# Altium schematic sheet Control & Inputs.SchDoc
size A; SheetNumber: 2; SheetTotal: 3
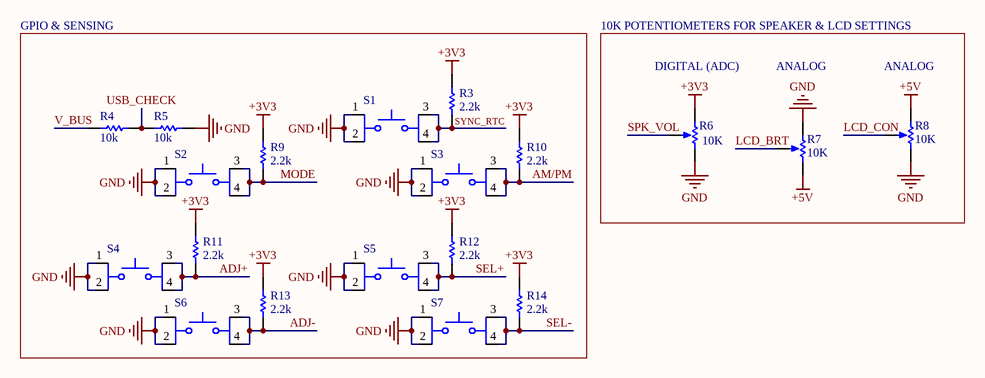
[diagram p0: Control & Inputs.SchDoc]

## Parts
R3  Resistance: 2.2k  [RESA60-630X240]  (hidden comment: MFR-25FBF52-1M)
R4  Resistance: 10k  [RESA60-630X240]  (hidden comment: MFR-25FBF52-1M)
R5  Resistance: 10k  [RESA60-630X240]  (hidden comment: MFR-25FBF52-1M)
R6  value 10K  [POT OFFSET 200]  (hidden comment: RPot_3)
R7  value 10K  [POT OFFSET 200]  (hidden comment: RPot_3)
R8  value 10K  [POT OFFSET 200]  (hidden comment: RPot_3)
R9  Resistance: 2.2k  [RESA60-630X240]  (hidden comment: MFR-25FBF52-1M)
R10  Resistance: 2.2k  [RESA60-630X240]  (hidden comment: MFR-25FBF52-1M)
R11  Resistance: 2.2k  [RESA60-630X240]  (hidden comment: MFR-25FBF52-1M)
R12  Resistance: 2.2k  [RESA60-630X240]  (hidden comment: MFR-25FBF52-1M)
R13  Resistance: 2.2k  [RESA60-630X240]  (hidden comment: MFR-25FBF52-1M)
R14  Resistance: 2.2k  [RESA60-630X240]  (hidden comment: MFR-25FBF52-1M)
S1  TL1105AF160Q  [SW_TL1105AF160Q]  (value not drawn)
S2  TL1105AF160Q  [SW_TL1105AF160Q]  (value not drawn)
S3  TL1105AF160Q  [SW_TL1105AF160Q]  (value not drawn)
S4  TL1105AF160Q  [SW_TL1105AF160Q]  (value not drawn)
S5  TL1105AF160Q  [SW_TL1105AF160Q]  (value not drawn)
S6  TL1105AF160Q  [SW_TL1105AF160Q]  (value not drawn)
S7  TL1105AF160Q  [SW_TL1105AF160Q]  (value not drawn)

## Blocks framed on the sheet
GPIO & SENSING: R3-R5 R9-R14 S1-S7

## Nets
+3V3: R3.2 R6.1(TOP) R9.2 R10.2 R11.2 R12.2 R13.2 R14.2
+5V: R7.3(BOT) R8.1(TOP)
GND: R5.2 R6.3(BOT) R7.1(TOP) R8.3(BOT) S1.1 S1.2 S2.1 S2.2 S3.1 S3.2 S4.1 S4.2 S5.1 S5.2 S6.1 S6.2 S7.1 S7.2
ADJ+: R11.1 S4.3 S4.4
ADJ-: R13.1 S6.3 S6.4
AM/PM: R10.1 S3.3 S3.4
LCD_BRT: R7.2(TAP)
LCD_CON: R8.2(TAP)
MODE: R9.1 S2.3 S2.4
SEL+: R12.1 S5.3 S5.4
SEL-: R14.1 S7.3 S7.4
SPK_VOL: R6.2(TAP)
SYNC_RTC: R3.1 S1.3 S1.4
USB_CHECK: R4.2 R5.1
V_BUS: R4.1

## Notes on the sheet
- 10K POTENTIOMETERS FOR SPEAKER & LCD SETTINGS
- (near R6) DIGITAL (ADC)
- ANALOG
- (near R8) ANALOG

## Library data of the parts
R3-R5 R9-R14 = CMP-1659-00070-1: Axial Resistor, 1 MOhm, +/- 1%, 250 mW, -55 to 155 degC, 2-Pin THD, RoHS, Bulk; Power Rating: 250 mW; Voltage Rating: 250 V; ComponentLink1Description: Manufacturer URL; PackageReference: MFR-25; ComponentLink2Description: Datasheet; ComponentLink2URL: http://www.yageo.com/documents/recent/Yageo%20LR_MFR_2013.pdf; Tolerance: 1%; DatasheetVersion: Apr-13; Package Quantity: 200; Packaging: Bulk; Case\Package: Axial; RoHSCompliant: true; ComponentLink1URL: http://www.yageo.com/; Length: 0.248 inch; Min Operating Temperature: -55 degC; Mount: Through Hole; PackageDescription: 2-Pin Axial Lead, Dia 2.4 mm, Body Length 6.3 mm; Max Operating Temperature: 155 degC
R6-R8 = RPot: Potentiometer; Sim Note: Enter the Resistance value and the set point into parameter fields.; Set Position: 0.5; Published: 8-Jun-2000; LatestRevisionDate: 17-Jul-2002; LatestRevisionNote: Re-released for DXP Platform.; Publisher: Altium Limited
S1-S7 = TL1105AF160Q: Tactile Switch SPST-NO Top Actuated Through Hole; MF: E-Switch; SnapEDA_Link: https://www.snapeda.com/parts/TL1105AF160Q/E-Switch/view-part/?ref=snap; Package: None; Value: *; MP: TL1105AF160Q; Check_prices: https://www.snapeda.com/parts/TL1105AF160Q/E-Switch/view-part/?ref=eda